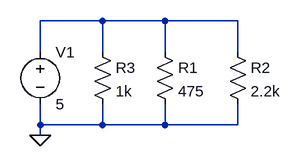
[diagram p0: schematic C4.asc]
C4.asc, the LTspice schematic file:
Version 4
SHEET 1 880 680
WIRE 128 80 32 80
WIRE 224 80 128 80
WIRE 336 80 224 80
WIRE 32 128 32 80
WIRE 128 128 128 80
WIRE 224 128 224 80
WIRE 336 128 336 80
WIRE 32 240 32 208
WIRE 128 240 128 208
WIRE 128 240 32 240
WIRE 224 240 224 208
WIRE 224 240 128 240
WIRE 336 240 336 208
WIRE 336 240 224 240
WIRE 32 256 32 240
FLAG 32 256 0
SYMBOL res 208 112 R0
SYMATTR InstName R1
SYMATTR Value 475
SYMBOL res 320 112 R0
SYMATTR InstName R2
SYMATTR Value 2.2k
SYMBOL res 112 112 R0
SYMATTR InstName R3
SYMATTR Value 1k
SYMBOL voltage 32 112 R0
WINDOW 123 0 0 Left 0
WINDOW 39 0 0 Left 0
SYMATTR InstName V1
SYMATTR Value 5

The netlist it stands for:
* C4.asc
R1 N001 0 475
R2 N001 0 2.2k
R3 N001 0 1k
V1 N001 0 5
.backanno
.end